# Altium schematic sheet Schematic_2026-10-29.schdoc
size 276 x 279 mm
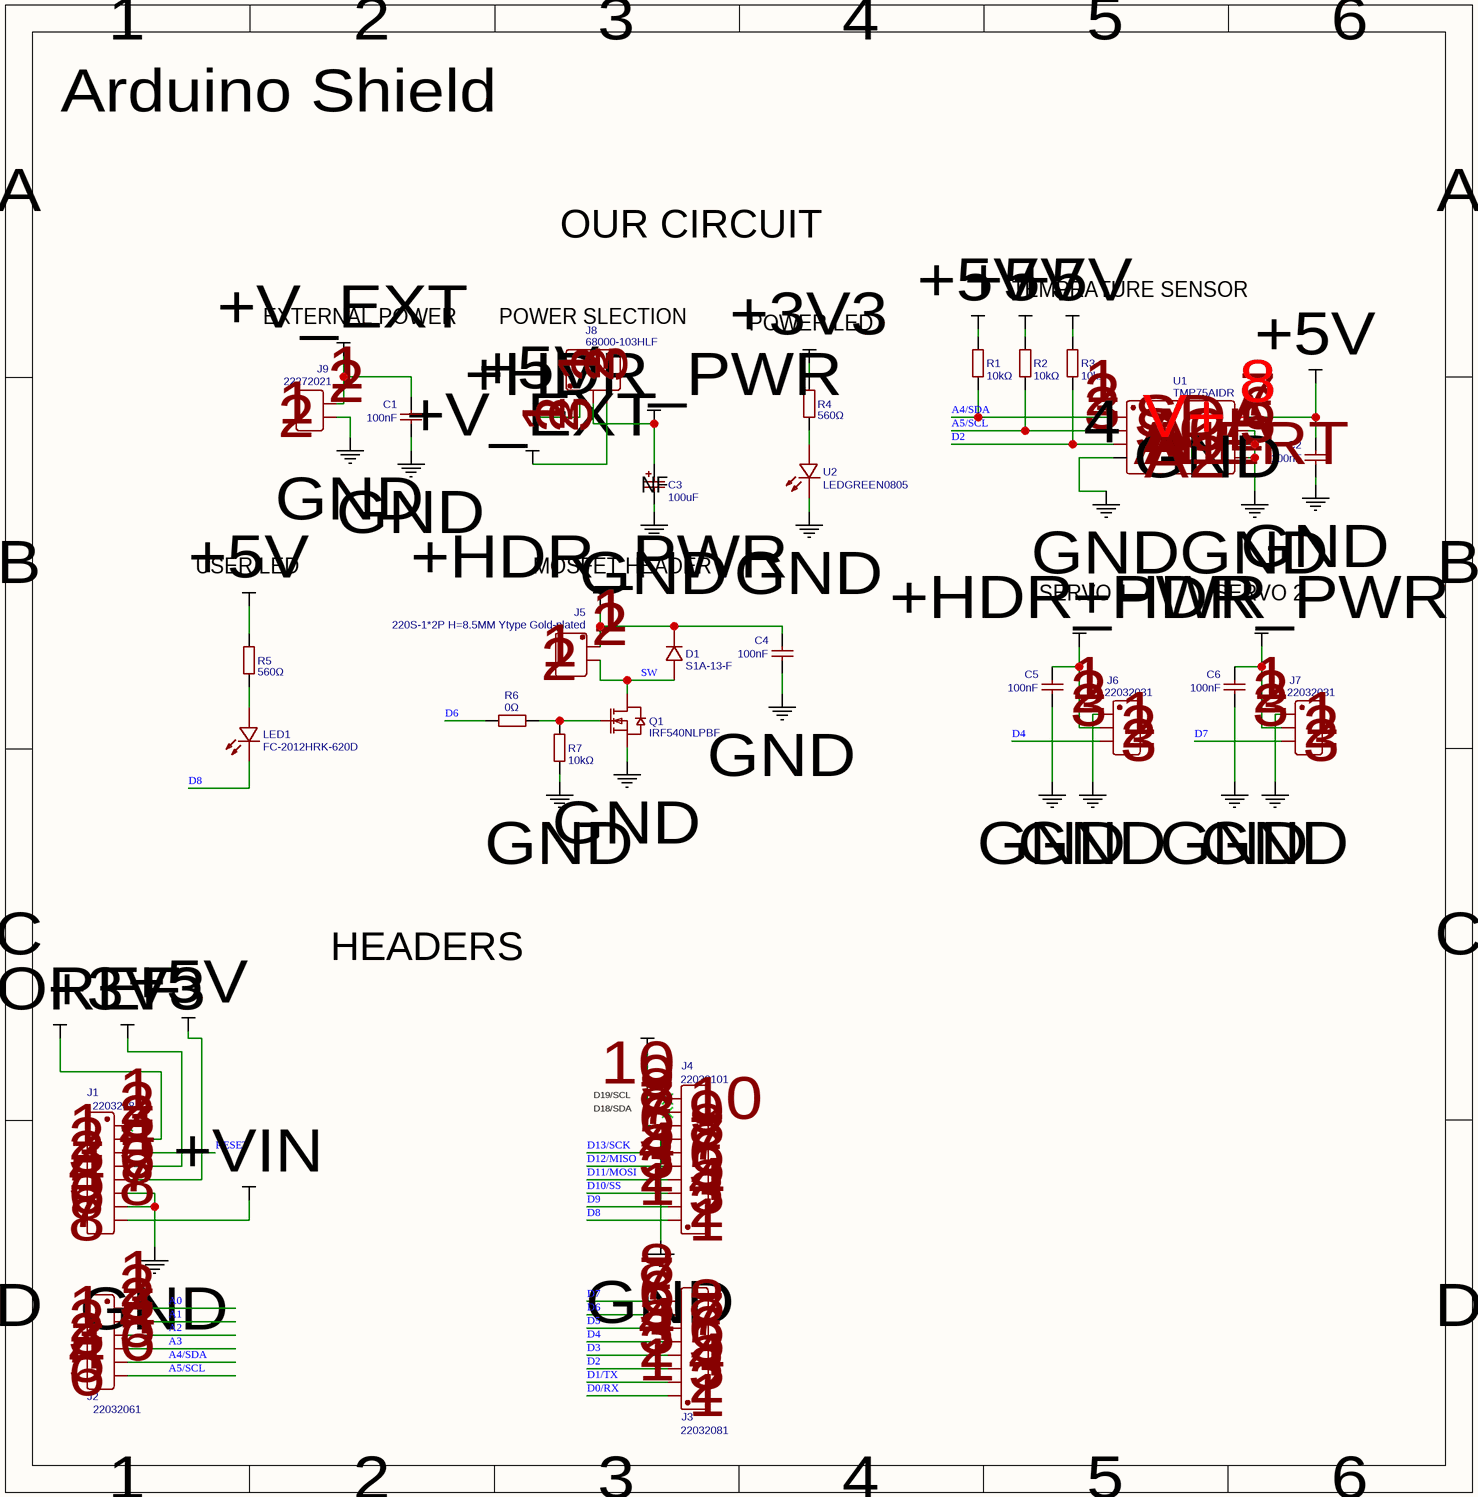
[diagram p0: Schematic_2026-10-29.schdoc]

## Parts
C1  100nF  [C0805]
C2  100nF  [C0805]
C3  100uF  [CASE-B_3528]
C4  100nF  [C0805]
C5  100nF  [C0805]
C6  100nF  [C0805]
D1  S1A-13-F  [SMA_L4.4-W2.8-LS5.4-RD]
J1  22032081  [HDR-TH_8P-P2.54-V-M]
J2  22032061  [CONN-TH_6P-P2.54_22032061]
J3  22032081  [HDR-TH_8P-P2.54-V-M]
J4  22032101  [HDR-TH_10P-P2.54-V-M]
J5  220S-1*2P H=8.5MM Ytype Gold-plated  [HDR-TH_2P-P2.54-V-F]
J6  22032031  [CONN-TH_22032031]
J7  22032031  [CONN-TH_22032031]
J8  68000-103HLF  [HDR-TH_3P-P2.54-V-M-1]
J9  22272021  [CONN-TH_22272021]
LED1  FC-2012HRK-620D  [LED0805-RD]
Q1  IRF540NLPBF  [TO-262-3_L10.2-W4.6-P2.54-L]
R1  10kΩ  [R0805]
R2  10kΩ  [R0805]
R3  10kΩ  [R0805]
R4  560Ω  [R0805]
R5  560Ω  [R0805]
R6  0Ω  [R0805]
R7  10kΩ  [R0805]
U1  TMP75AIDR  [SOIC-8_L4.9-W3.9-P1.27-LS6.0-BL]
U2  LEDGREEN0805  [LED0805-R-RD_GREEN]

## Nets
+3V3: J1.4 R4.2
+5V: C2.2 J1.5 J8.1 R1.2 R2.2 R3.2 R5.2 U1.8(V+)
+AREF: J4.8
+HDR_PWR: C3.1 C4.2 C5.2 C6.2 D1.1(K) J5.1 J6.2 J7.2 J8.2
+IOREF: J1.2
+V_EXT: C1.2 J8.3 J9.1
+VIN: J1.8
GND: C1.1 C2.1 C3.2 C4.1 C5.1 C6.1 J1.6 J1.7 J4.7 J6.1 J7.1 J9.2 Q1.3(S) R7.1 U1.4(GND) U1.5(A2) U1.6(A1) U1.7(A0) U2.2(K)
A0: J2.1
A1: J2.2
A2: J2.3
A3: J2.4
A4/SDA: J2.5 R1.1 U1.1(SDA)
A5/SCL: J2.6 R2.1 U1.2(SCL)
D0/RX: J3.1
D1/TX: J3.2
D2: J3.3 R3.1 U1.3(ALERT)
D3: J3.4
D4: J3.5 J6.3
D5: J3.6
D6: J3.7 R6.1
D7: J3.8 J7.3
D8: J4.1 LED1.1(-)
D9: J4.2
D10/SS: J4.3
D11/MOSI: J4.4
D12/MISO: J4.5
D13/SCK: J4.6
RESET: J1.3
SW: D1.2(A) J5.2 Q1.2(D)
NetLED1_2: LED1.2(+) R5.1
NetQ1_1: Q1.1(G) R6.2 R7.2
NetR4_1: R4.1 U2.1(A)

Not connected (* = marked no-connect by the designer): J1 1*; J4 9* 10*

## Notes on the sheet
- Arduino Shield
- OUR CIRCUIT
- TEMPRATURE SENSOR
- EXTERNAL POWER
- POWER SLECTION
- (near R4) POWER LED
- (near C3) NF
- USER LED
- MOSFET HEADER
- SERVO 1
- SERVO 2
- HEADERS
- D19/SCL
- D18/SDA

## Library data of the parts
C1 C2 C4-C6 = 100nF: Manufacturer Part: CL21B104KCFNNNE; Manufacturer: SAMSUNG(三星); nameAlias: Value; Supplier: LCSC; Supplier Part: C28233; JLCPCB Part Class: Basic Part; spicePre: C; spiceSymbolName: CL21B104KCFNNNE
C3 = 100uF: Manufacturer: Kyocera AVX; Manufacturer Part: TAJB107K006RNJ; nameAlias: Value; Supplier: LCSC; Supplier Part: C16133; JLCPCB Part Class: Basic Part; spicePre: C; spiceSymbolName: TAJB107K006RNJ
D1 = S1A-13-F: Manufacturer: DIODES(美台); Contributor: LCSC; Supplier: LCSC; Manufacturer Part: S1A-13-F; Supplier Part: C150735; JLCPCB Part Class: Extended Part; spicePre: D; spiceSymbolName: S1A-13-F
J1 J3 = 22032081: Manufacturer: MOLEX; Contributor: LCSC; Supplier: LCSC; Supplier Part: C586971; Manufacturer Part: 22032081; JLCPCB Part Class: Extended Part; spicePre: H; spiceSymbolName: 22032081
J2 = 22032061: Manufacturer: MOLEX; Contributor: LCSC; Supplier: LCSC; Supplier Part: C505159; Manufacturer Part: 22032061; JLCPCB Part Class: Extended Part; spicePre: C; spiceSymbolName: 22032061
J4 = 22032101: Manufacturer: MOLEX; Contributor: LCSC; Supplier: LCSC; Supplier Part: C586972; Manufacturer Part: 22032101; JLCPCB Part Class: Extended Part; spicePre: H; spiceSymbolName: 22032101
J5 = 220S-1*2P H=8.5MM Ytype Gold-plated: Manufacturer: Ckmtw(灿科盟); Manufacturer Part: B-2200S02P-A120; Contributor: LCSC; Supplier: LCSC; Supplier Part: C124411; JLCPCB Part Class: Extended Part; spicePre: H; spiceSymbolName: 220S-1*2P H=8.5MM Ytype Gold-plated
J6 J7 = 22032031: Manufacturer: MOLEX; Contributor: LCSC; Supplier: LCSC; Supplier Part: C505002; Manufacturer Part: 22032031; JLCPCB Part Class: Extended Part; spicePre: C; spiceSymbolName: 22032031
J8 = 68000-103HLF: Manufacturer: Amphenol; Contributor: LCSC; Supplier: LCSC; Supplier Part: C168677; Manufacturer Part: 68000-103HLF; JLCPCB Part Class: Extended Part; spicePre: H; spiceSymbolName: 68000-103HLF
J9 = 22272021: Manufacturer: MOLEX; Contributor: LCSC; Supplier: LCSC; Supplier Part: C293316; Manufacturer Part: 22272021; JLCPCB Part Class: Extended Part; spicePre: C; spiceSymbolName: 22272021
LED1 = FC-2012HRK-620D: Manufacturer: 国星光电; Manufacturer Part: NCD0805R1; Supplier: LCSC; Supplier Part: C84256; JLCPCB Part Class: Basic Part; spicePre: L; spiceSymbolName: FC-2012HRK-620D
Q1 = IRF540NLPBF: Manufacturer: Infineon(英飞凌); Contributor: lcsc; Supplier: LCSC; Supplier Part: C459969; Manufacturer Part: IRF540NLPBF; JLCPCB Part Class: Extended Part; spicePre: Q; spiceSymbolName: IRF540NLPBF
R1-R3 R7 = 10kΩ: Manufacturer: UNI-ROYAL(厚声); Manufacturer Part: 0805W8F1002T5E; nameAlias: Value; Supplier: LCSC; Supplier Part: C17414; JLCPCB Part Class: Basic Part; spicePre: R; spiceSymbolName: 0805W8F1002T5E
R4 R5 = 560Ω: Manufacturer: UNI-ROYAL(厚声); Manufacturer Part: 0805W8F5600T5E; nameAlias: Value; Supplier: LCSC; Supplier Part: C28636; JLCPCB Part Class: Basic Part; spicePre: R; spiceSymbolName: 0805W8F5600T5E
R6 = 0Ω: Manufacturer: UNI-ROYAL(厚声); Manufacturer Part: 0805W8F0000T5E; nameAlias: Value; Supplier: LCSC; Supplier Part: C17477; JLCPCB Part Class: Basic Part; spicePre: R; spiceSymbolName: 0805W8F0000T5E
U1 = TMP75AIDR: Manufacturer: TI(德州仪器); Supplier: LCSC; Manufacturer Part: TMP75AIDR; Supplier Part: C30389; JLCPCB Part Class: Extended Part; spicePre: U; spiceSymbolName: TMP75AIDR
U2 = LEDGREEN0805: Manufacturer: null; Contributor: LCSC; Supplier: LCSC; Supplier Part: C9900013047; Manufacturer Part: LEDGREEN0805; JLCPCB Part Class: Extended Part; spicePre: U; spiceSymbolName: LEDGREEN0805